# EAGLE schematic Claritone_Main (EAGLE 9.7.0)
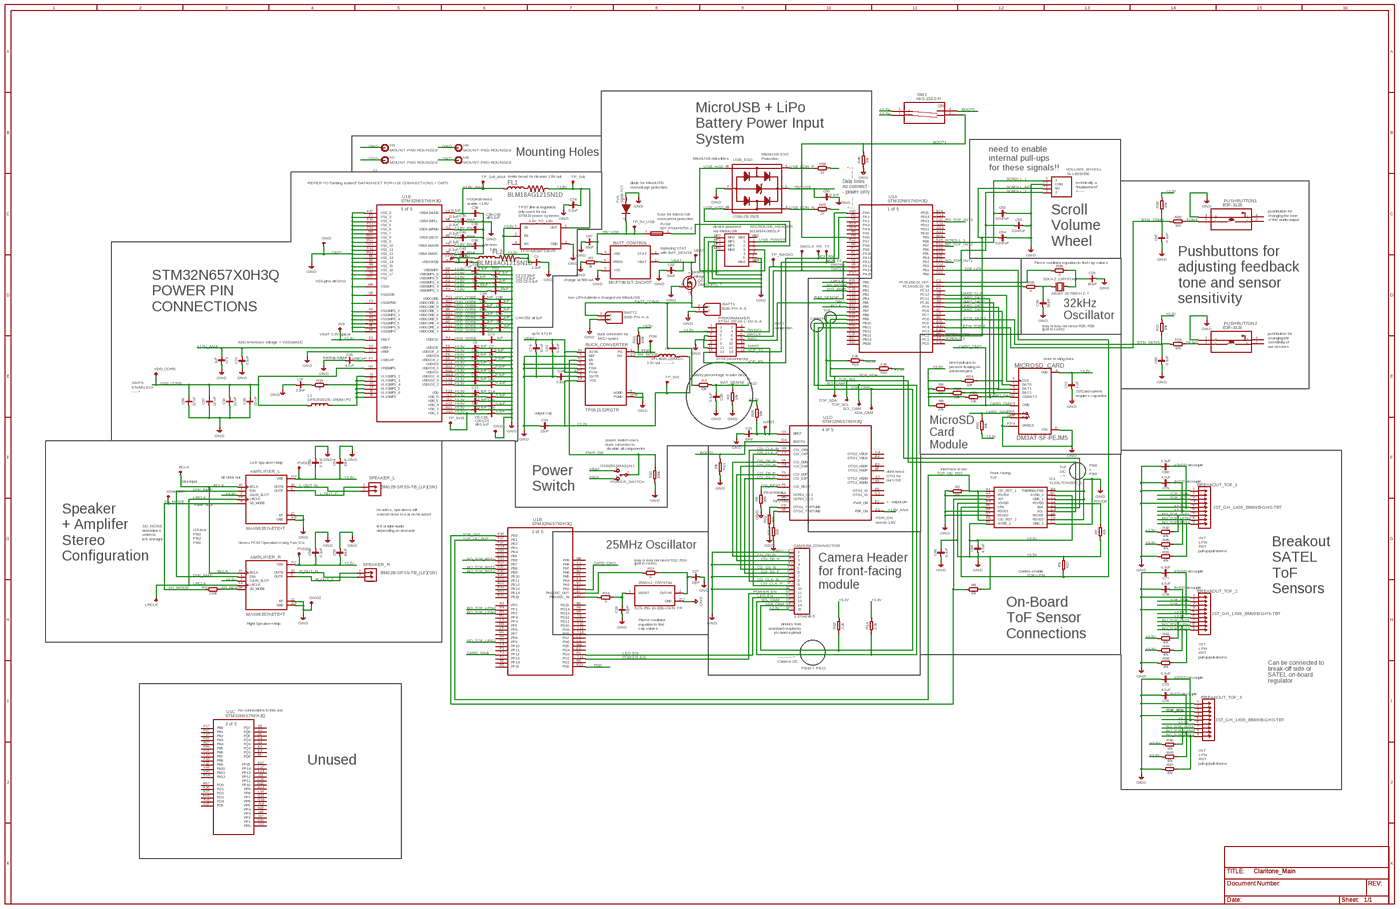
[diagram p0: schematic, sheet 1, overview]
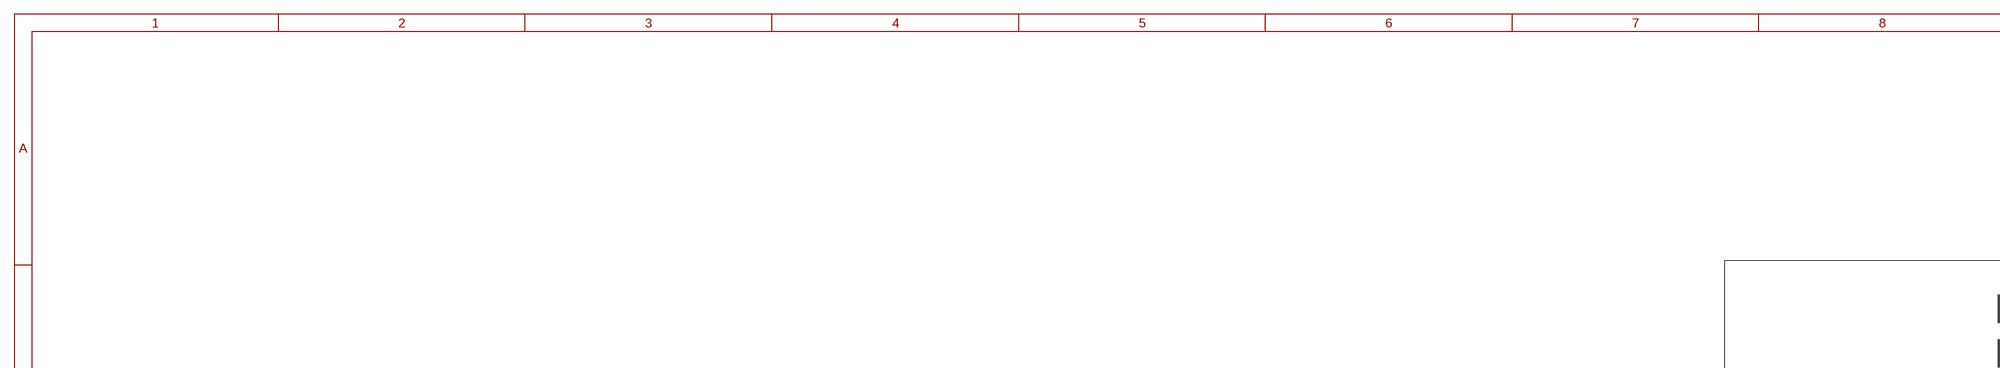
[diagram p1: schematic, sheet 1, part 1 of 4]
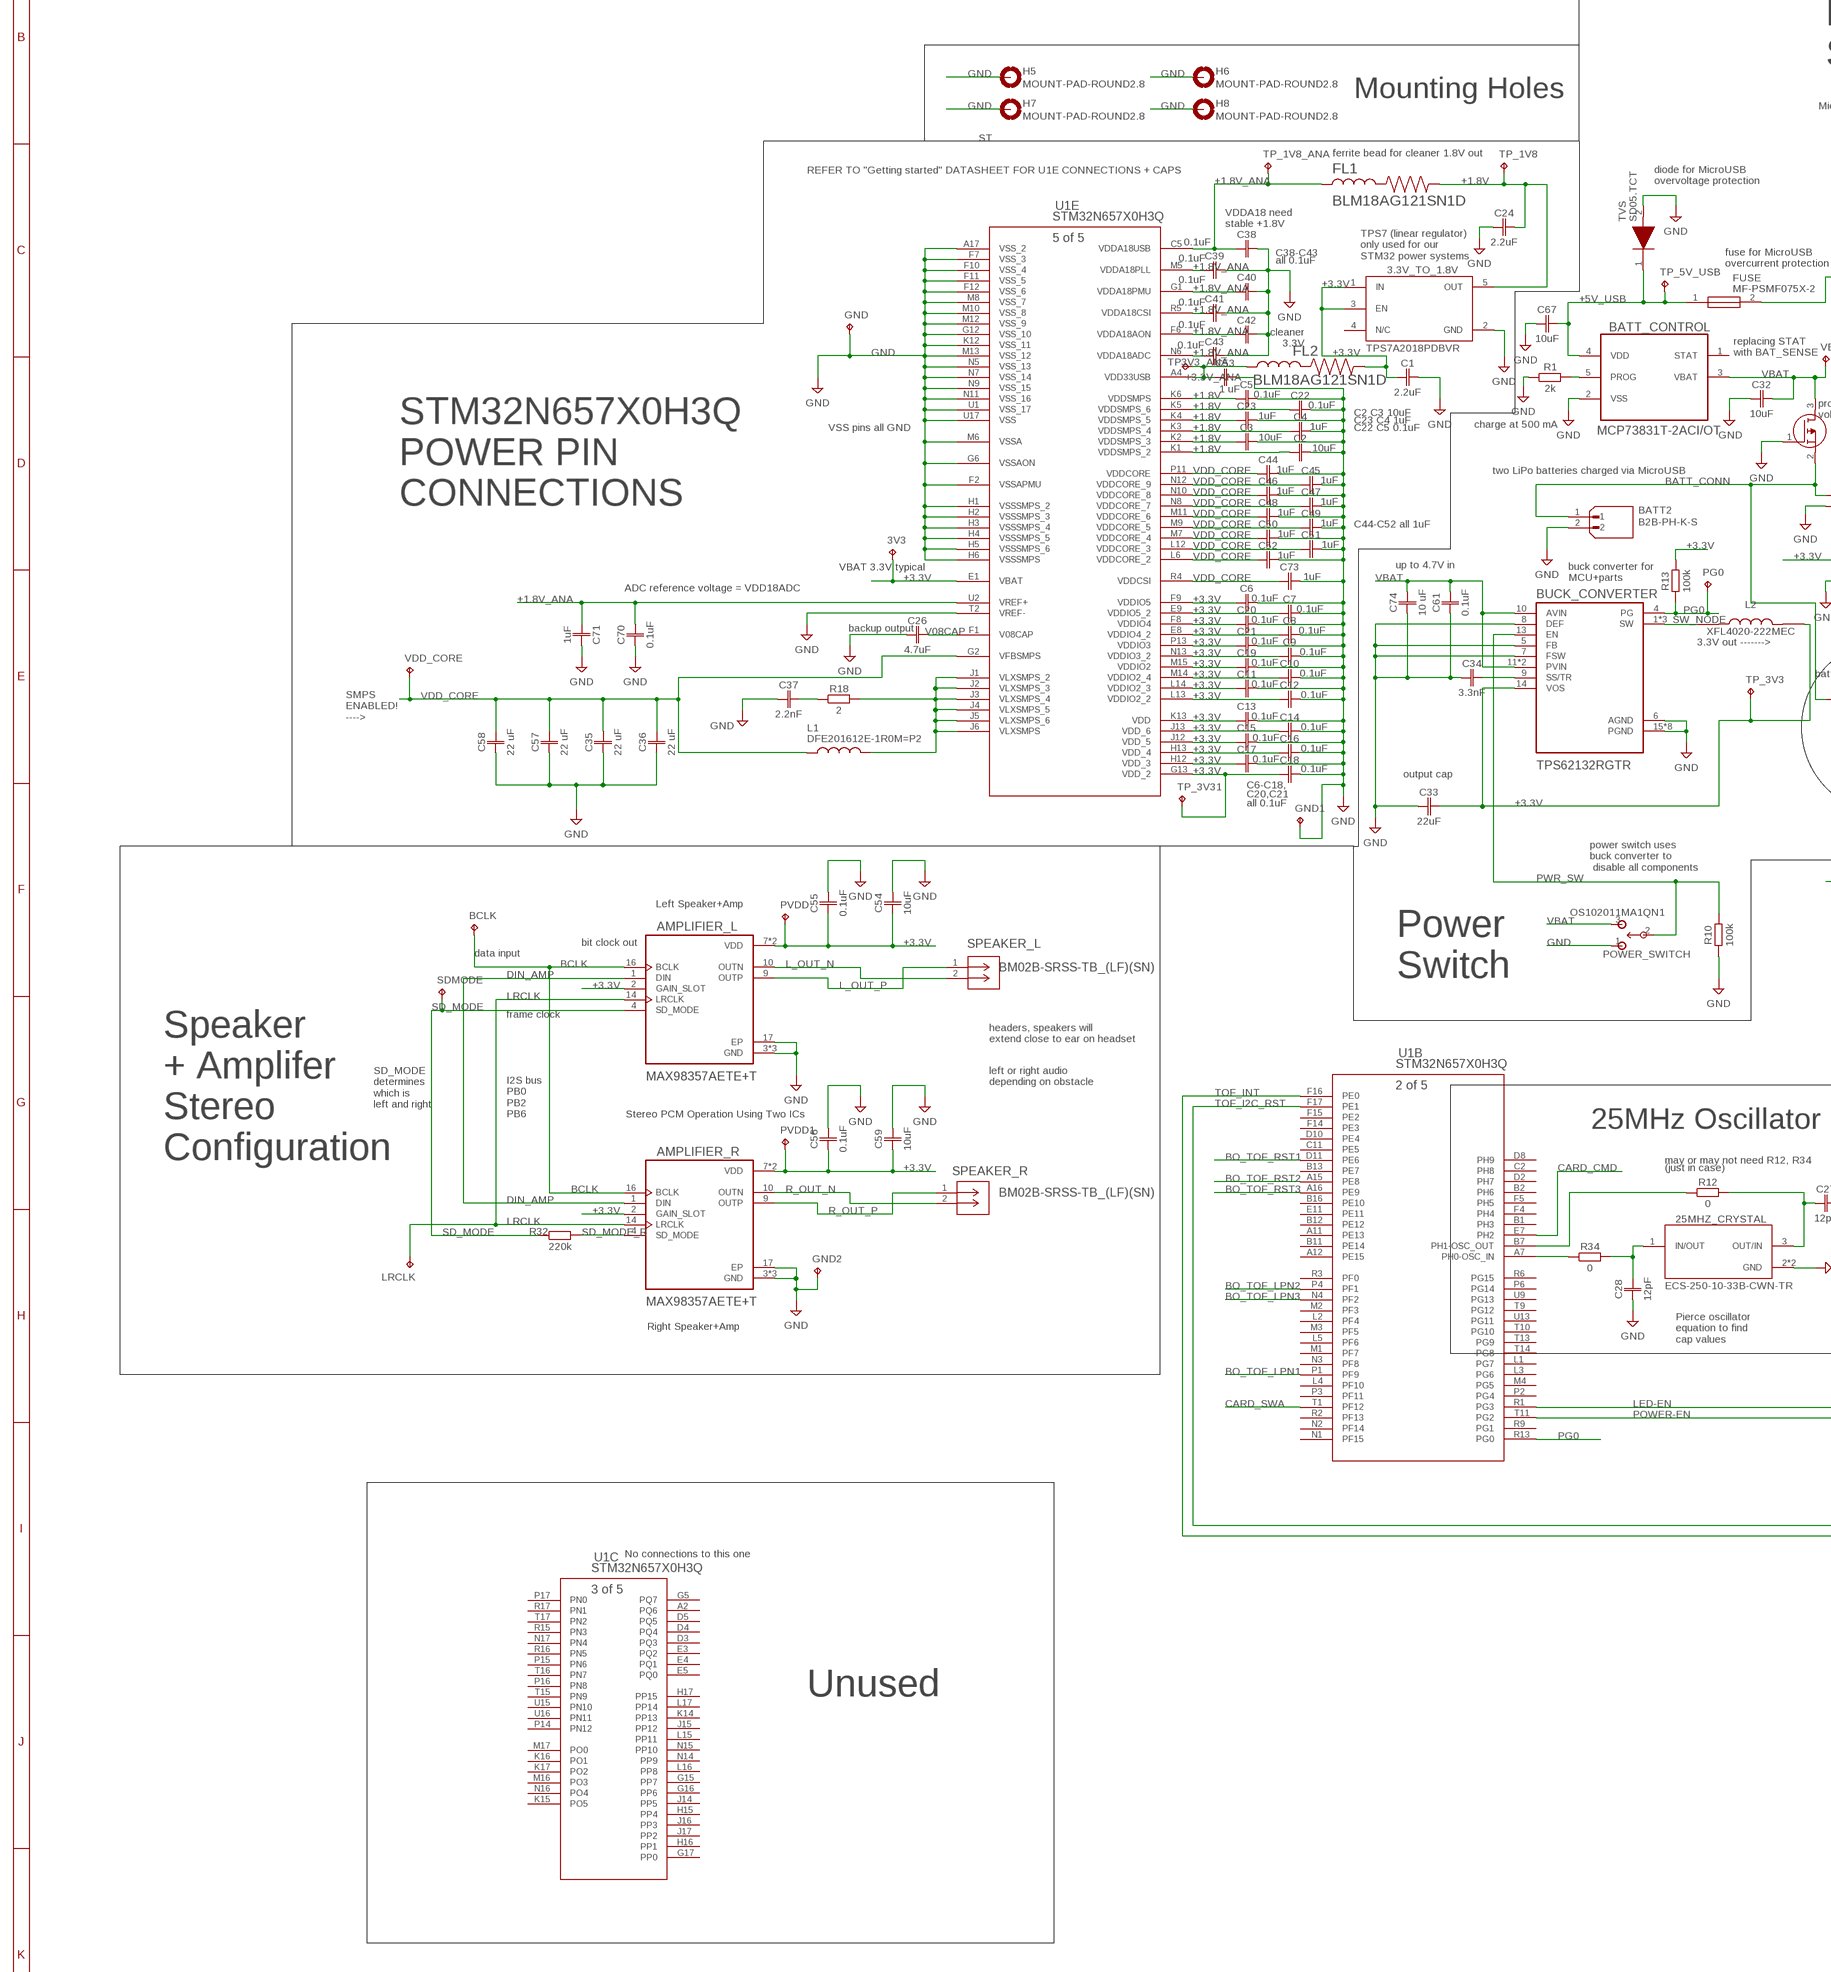
[diagram p2: schematic, sheet 1, part 2 of 4]
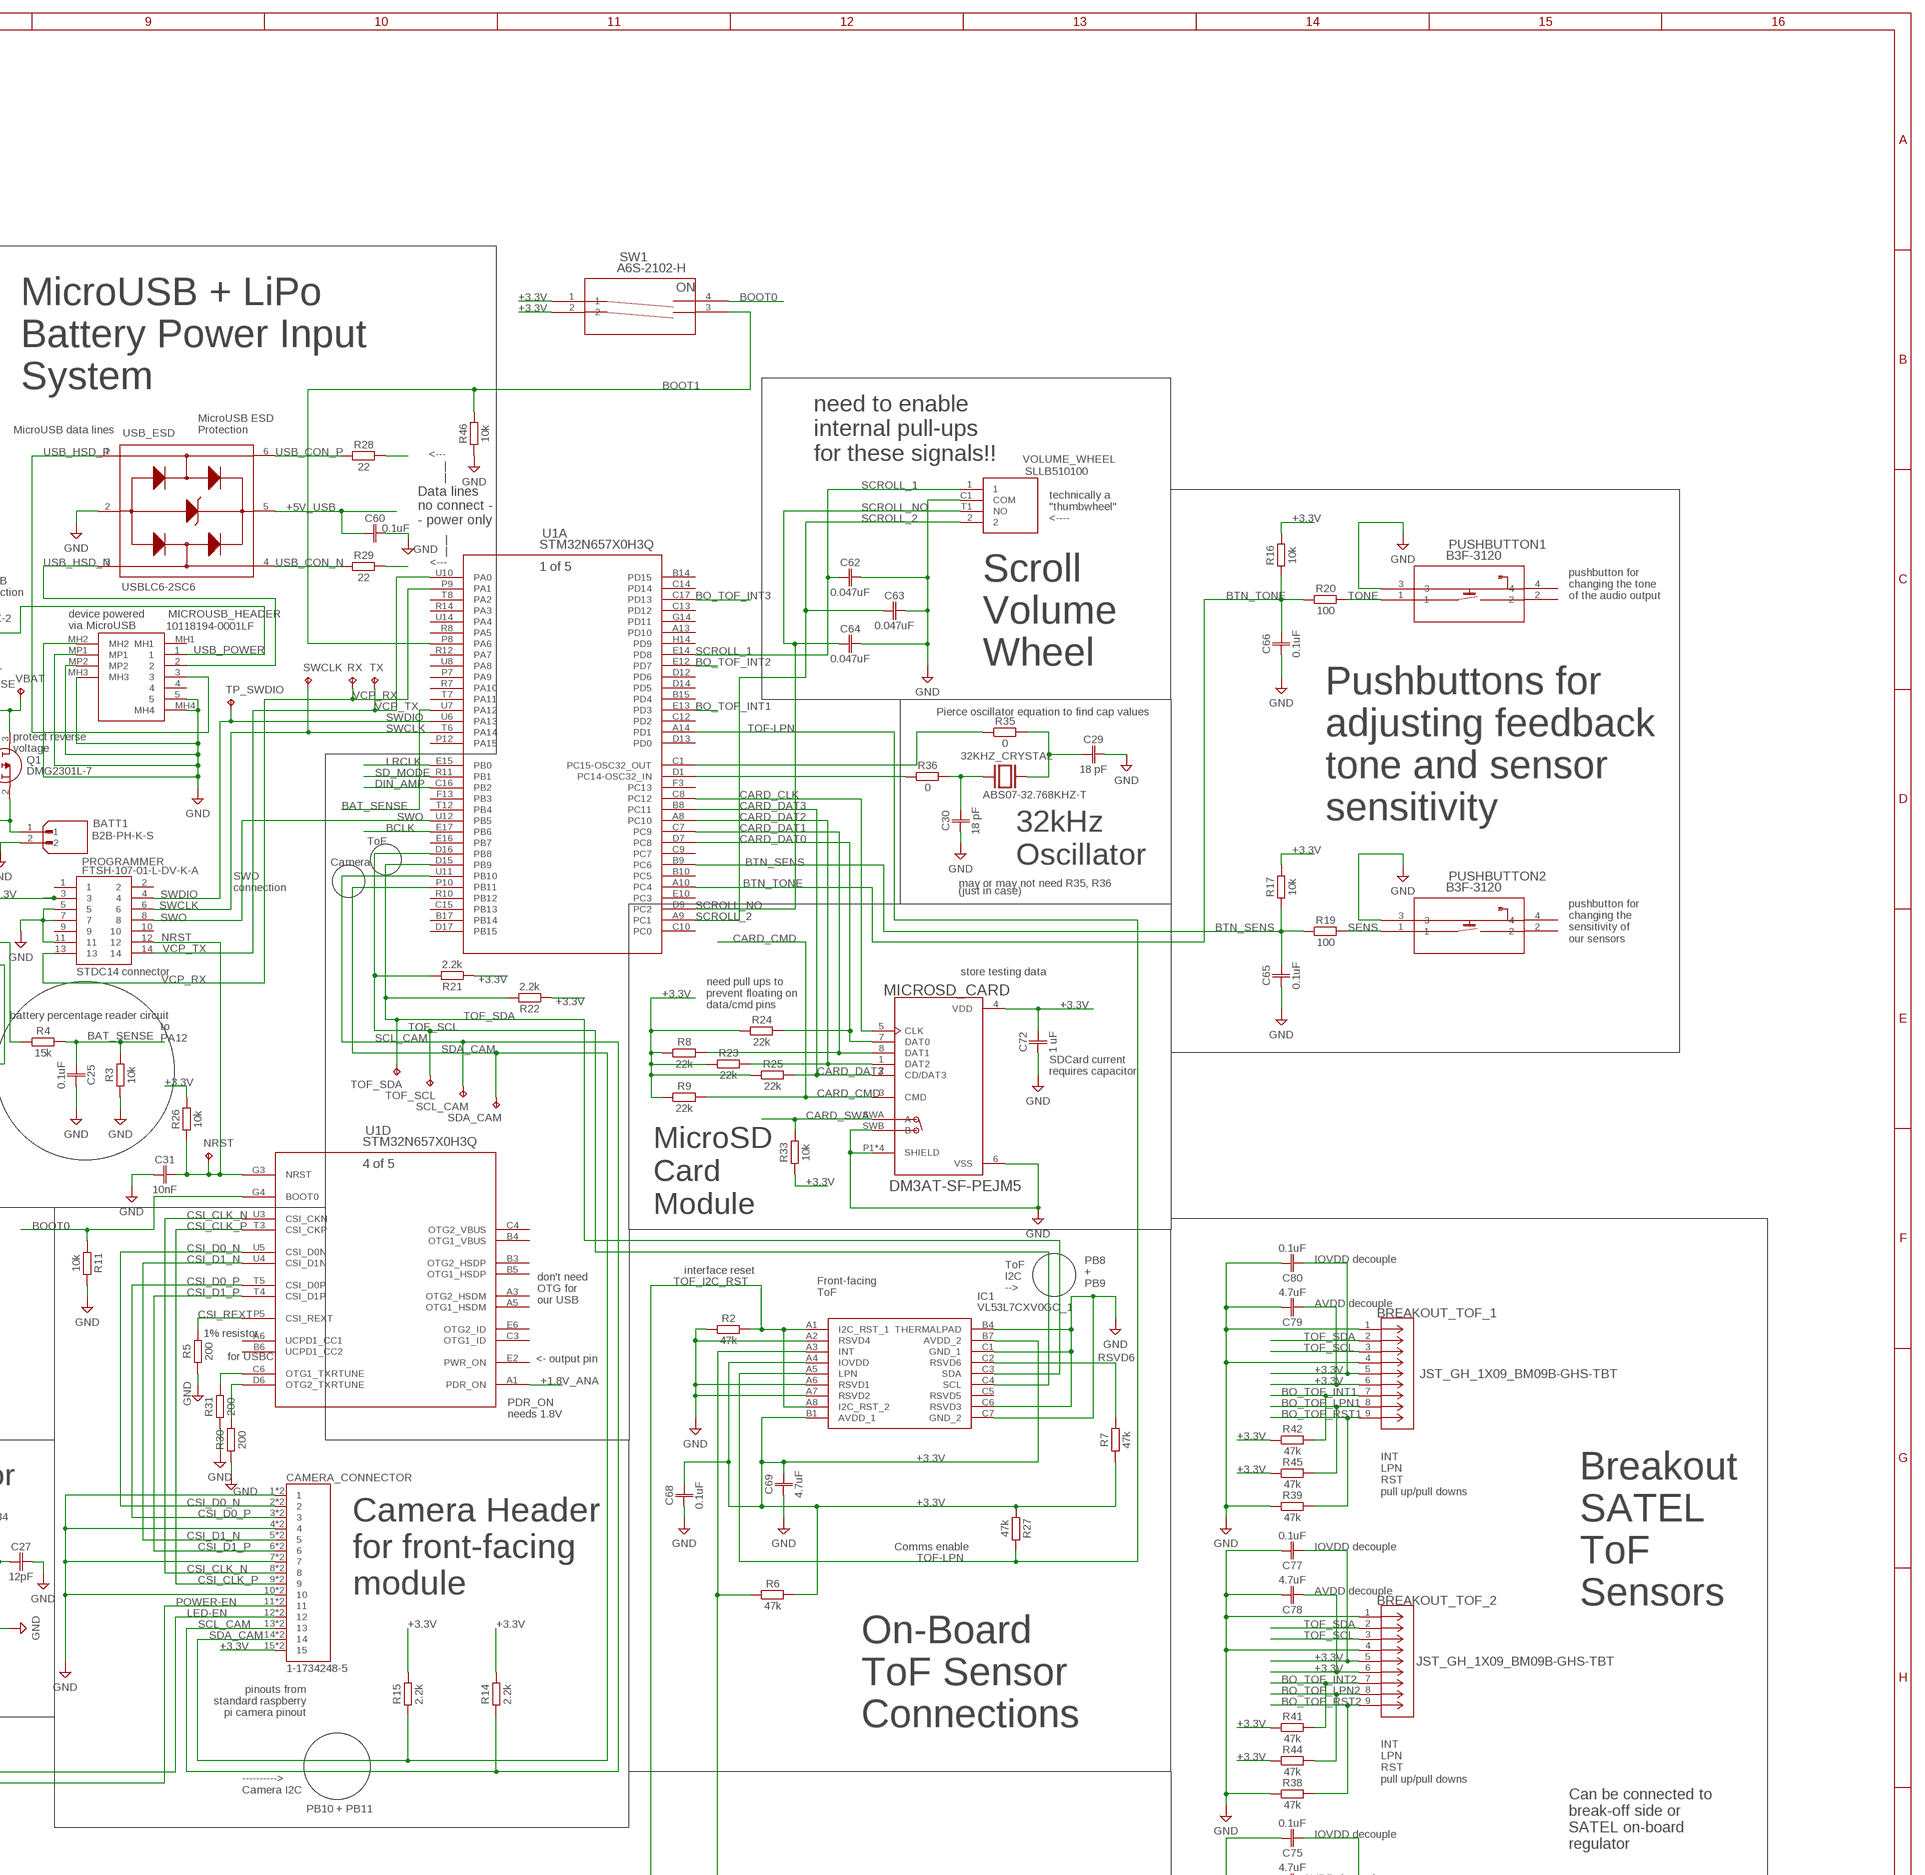
[diagram p3: schematic, sheet 1, part 3 of 4]
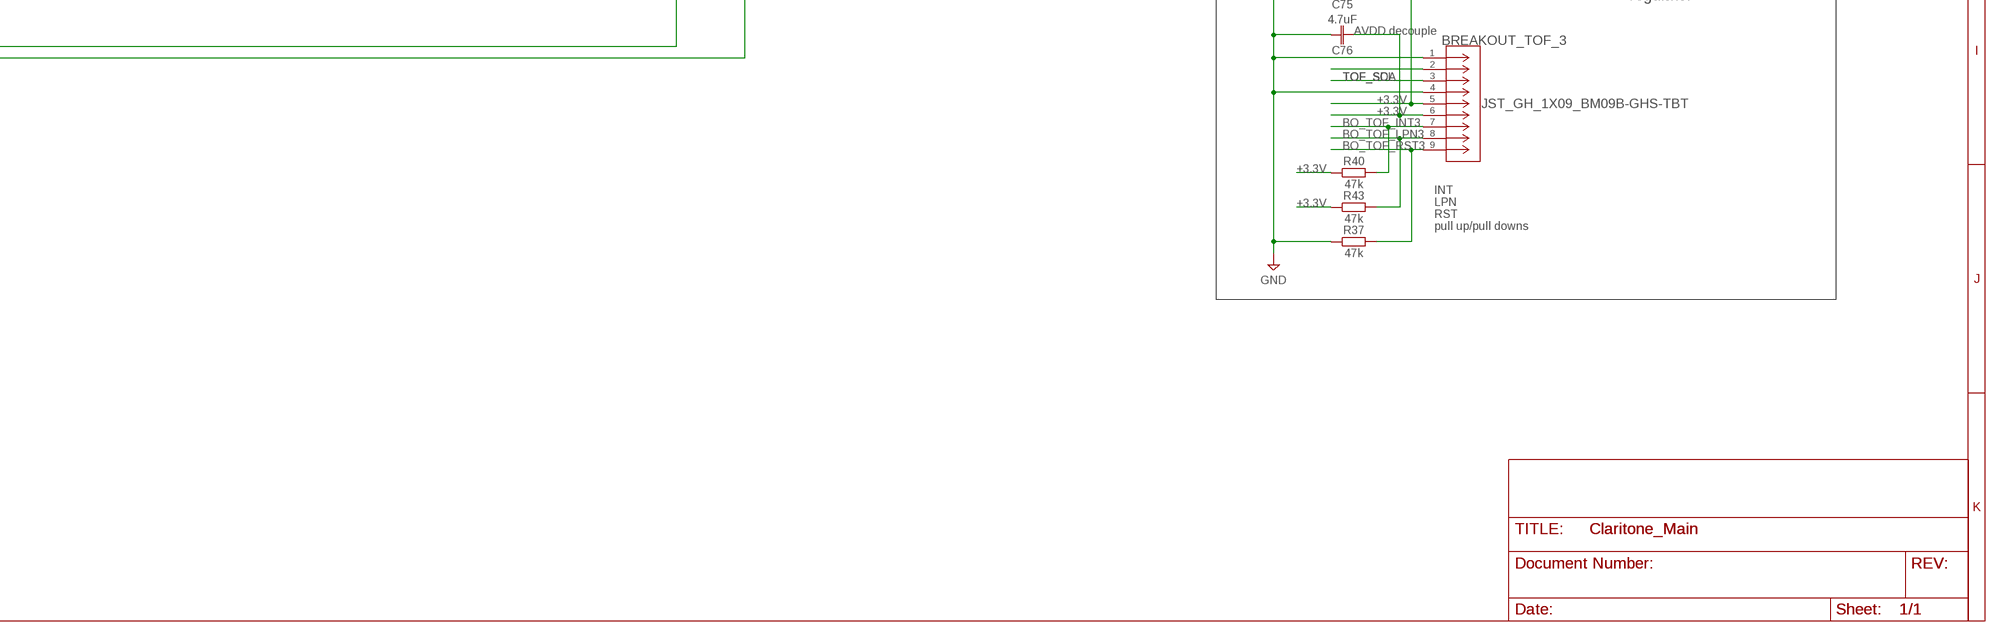
[diagram p4: schematic, sheet 1, part 4 of 4]

## Parts
3.3V_TO_1.8V  TPS7A2018PDBVR  [SOT95P280X145-5N(3)]
3V3  TPPAD1-13Y  [P1-13Y]
25MHZ_CRYSTAL  ECS-250-10-33B-CWN-TR  [XTAL_ECS-250-10-33B-CWN-TR]
32KHZ_CRYSTAL  ABS07-32.768KHZ-T  [XTAL_ABS07-32.768KHZ-T]
AMPLIFIER_L  MAX98357AETE+T  [QFN50P300X300X80-17N]
AMPLIFIER_R  MAX98357AETE+T  [QFN50P300X300X80-17N]
BATT1  B2B-PH-K-S  [JST_B2B-PH-K-S]
BATT2  B2B-PH-K-S  [JST_B2B-PH-K-S]
BATT_CONTROL  MCP73831T-2ACI/OT  [SOT95P280X145-5N(1)]
BCLK  TPTP06R  [TP06R]
BREAKOUT_TOF_1  JST_GH_1X09_BM09B-GHS-TBT  [CONN_BM09B-GHS-TBT_JST]
BREAKOUT_TOF_2  JST_GH_1X09_BM09B-GHS-TBT  [CONN_BM09B-GHS-TBT_JST]
BREAKOUT_TOF_3  JST_GH_1X09_BM09B-GHS-TBT  [CONN_BM09B-GHS-TBT_JST]
BUCK_CONVERTER  TPS62132RGTR  [QFN50P300X300X100-17N]
C1  2.2uF  C_CHIP-0402(1005-METRIC)  [CAPC1005X60]
C2  10uF  C_CHIP-0603(1608-METRIC)  [CAPC1608X85]
C3  10uF  C_CHIP-0603(1608-METRIC)  [CAPC1608X85]
C4  1uF  C_CHIP-0402(1005-METRIC)  [CAPC1005X60]
C5  0.1uF  C_CHIP-0402(1005-METRIC)  [CAPC1005X60]
C6  0.1uF  C_CHIP-0402(1005-METRIC)  [CAPC1005X60]
C7  0.1uF  C_CHIP-0402(1005-METRIC)  [CAPC1005X60]
C8  0.1uF  C_CHIP-0402(1005-METRIC)  [CAPC1005X60]
C9  0.1uF  C_CHIP-0402(1005-METRIC)  [CAPC1005X60]
C10  0.1uF  C_CHIP-0402(1005-METRIC)  [CAPC1005X60]
C11  0.1uF  C_CHIP-0402(1005-METRIC)  [CAPC1005X60]
C12  0.1uF  C_CHIP-0402(1005-METRIC)  [CAPC1005X60]
C13  0.1uF  C_CHIP-0402(1005-METRIC)  [CAPC1005X60]
C14  0.1uF  C_CHIP-0402(1005-METRIC)  [CAPC1005X60]
C15  0.1uF  C_CHIP-0402(1005-METRIC)  [CAPC1005X60]
C16  0.1uF  C_CHIP-0402(1005-METRIC)  [CAPC1005X60]
C17  0.1uF  C_CHIP-0402(1005-METRIC)  [CAPC1005X60]
C18  0.1uF  C_CHIP-0402(1005-METRIC)  [CAPC1005X60]
C19  0.1uF  C_CHIP-0402(1005-METRIC)  [CAPC1005X60]
C20  0.1uF  C_CHIP-0402(1005-METRIC)  [CAPC1005X60]
C21  0.1uF  C_CHIP-0402(1005-METRIC)  [CAPC1005X60]
C22  0.1uF  C_CHIP-0402(1005-METRIC)  [CAPC1005X60]
C23  1uF  C_CHIP-0402(1005-METRIC)  [CAPC1005X60]
C24  2.2uF  C_CHIP-0402(1005-METRIC)  [CAPC1005X60]
C25  0.1uF  C_CHIP-0402(1005-METRIC)  [CAPC1005X60]
C26  4.7uF  C_CHIP-0402(1005-METRIC)  [CAPC1005X60]
C27  12pF  C_CHIP-0402(1005-METRIC)  [CAPC1005X60]
C28  12pF  C_CHIP-0402(1005-METRIC)  [CAPC1005X60]
C29  18 pF  C_CHIP-0402(1005-METRIC)  [CAPC1005X60]
C30  18 pF  C_CHIP-0402(1005-METRIC)  [CAPC1005X60]
C31  10nF  C_CHIP-0402(1005-METRIC)  [CAPC1005X60]
C32  10uF  C_CHIP-0603(1608-METRIC)  [CAPC1608X85]
C33  22uF  C_CHIP-0603(1608-METRIC)  [CAPC1608X85]
C34  3.3nF  C_CHIP-0402(1005-METRIC)  [CAPC1005X60]
C35  22 uF  C_CHIP-0603(1608-METRIC)  [CAPC1608X85]
C36  22 uF  C_CHIP-0603(1608-METRIC)  [CAPC1608X85]
C37  2.2nF  C_CHIP-0402(1005-METRIC)  [CAPC1005X60]
C38  0.1uF  C_CHIP-0402(1005-METRIC)  [CAPC1005X60]
C39  0.1uF  C_CHIP-0402(1005-METRIC)  [CAPC1005X60]
C40  0.1uF  C_CHIP-0402(1005-METRIC)  [CAPC1005X60]
C41  0.1uF  C_CHIP-0402(1005-METRIC)  [CAPC1005X60]
C42  0.1uF  C_CHIP-0402(1005-METRIC)  [CAPC1005X60]
C43  0.1uF  C_CHIP-0402(1005-METRIC)  [CAPC1005X60]
C44  1uF  C_CHIP-0402(1005-METRIC)  [CAPC1005X60]
C45  1uF  C_CHIP-0402(1005-METRIC)  [CAPC1005X60]
C46  1uF  C_CHIP-0402(1005-METRIC)  [CAPC1005X60]
C47  1uF  C_CHIP-0402(1005-METRIC)  [CAPC1005X60]
C48  1uF  C_CHIP-0402(1005-METRIC)  [CAPC1005X60]
C49  1uF  C_CHIP-0402(1005-METRIC)  [CAPC1005X60]
C50  1uF  C_CHIP-0402(1005-METRIC)  [CAPC1005X60]
C51  1uF  C_CHIP-0402(1005-METRIC)  [CAPC1005X60]
C52  1uF  C_CHIP-0402(1005-METRIC)  [CAPC1005X60]
C53  1 uF  C_CHIP-0402(1005-METRIC)  [CAPC1005X60]
C54  10uF  C_CHIP-0603(1608-METRIC)  [CAPC1608X85]
C55  0.1uF  C_CHIP-0402(1005-METRIC)  [CAPC1005X60]
C56  0.1uF  C_CHIP-0402(1005-METRIC)  [CAPC1005X60]
C57  22 uF  C_CHIP-0603(1608-METRIC)  [CAPC1608X85]
C58  22 uF  C_CHIP-0603(1608-METRIC)  [CAPC1608X85]
C59  10uF  C_CHIP-0603(1608-METRIC)  [CAPC1608X85]
C60  0.1uF  C_CHIP-0402(1005-METRIC)  [CAPC1005X60]
C61  0.1uF  C_CHIP-0402(1005-METRIC)  [CAPC1005X60]
C62  0.047uF  C_CHIP-0402(1005-METRIC)  [CAPC1005X60]
C63  0.047uF  C_CHIP-0402(1005-METRIC)  [CAPC1005X60]
C64  0.047uF  C_CHIP-0402(1005-METRIC)  [CAPC1005X60]
C65  0.1uF  C_CHIP-0402(1005-METRIC)  [CAPC1005X60]
C66  0.1uF  C_CHIP-0402(1005-METRIC)  [CAPC1005X60]
C67  10uF  C_CHIP-0603(1608-METRIC)  [CAPC1608X85]
C68  0.1uF  C_CHIP-0402(1005-METRIC)  [CAPC1005X60]
C69  4.7uF  C_CHIP-0603(1608-METRIC)  [CAPC1608X85]
C70  0.1uF  C_CHIP-0402(1005-METRIC)  [CAPC1005X60]
C71  1uF  C_CHIP-0402(1005-METRIC)  [CAPC1005X60]
C72  1 uF  C_CHIP-0402(1005-METRIC)  [CAPC1005X60]
C73  1uF  C_CHIP-0402(1005-METRIC)  [CAPC1005X60]
C74  10 uF  C_CHIP-0603(1608-METRIC)  [CAPC1608X85]
C75  0.1uF  C_CHIP-0402(1005-METRIC)  [CAPC1005X60]
C76  4.7uF  C_CHIP-0603(1608-METRIC)  [CAPC1608X85]
C77  0.1uF  C_CHIP-0402(1005-METRIC)  [CAPC1005X60]
C78  4.7uF  C_CHIP-0603(1608-METRIC)  [CAPC1608X85]
C79  4.7uF  C_CHIP-0603(1608-METRIC)  [CAPC1608X85]
C80  0.1uF  C_CHIP-0402(1005-METRIC)  [CAPC1005X60]
CAMERA_CONNECTOR  1-1734248-5  [TE_1-1734248-5]
FL1  BLM18AG121SN1D  [BEADC1608X95N]
FL2  BLM18AG121SN1D  [BEADC1608X95N]
FUSE  MF-PSMF075X-2  [MFPSMF075X2]
GND  TPPAD1-13Y  [P1-13Y]
GND1  TPTP08R  [TP08R]
GND2  TPTP08R  [TP08R]
H5  MOUNT-PAD-ROUND2.8  [2,8-PAD]
H6  MOUNT-PAD-ROUND2.8  [2,8-PAD]
H7  MOUNT-PAD-ROUND2.8  [2,8-PAD]
H8  MOUNT-PAD-ROUND2.8  [2,8-PAD]
IC1  VL53L7CXV0GC_1  [VL53L7CXV0GC1]
L1  DFE201612E-1R0M=P2  [INDC2016X120N]
L2  XFL4020-222MEC  [IND_XFL4020-222MEC]
LRCLK  TPTP06R  [TP06R]
MICROSD_CARD  DM3AT-SF-PEJM5  [HRS_DM3AT-SF-PEJM5]
MICROUSB_HEADER  10118194-0001LF  [101181940001LF]
NRST  TPTP06R  [TP06R]
PG0  TPTP06R  [TP06R]
POWER_SWITCH  OS102011MA1QN1  [SWITCH_11MA1QN1]
PROGRAMMER  FTSH-107-01-L-DV-K-A  [FTSH-107-XX-YYY-DV-K-A]
PUSHBUTTON1  B3F-3120  [SW_B3F-3120_OMR]
PUSHBUTTON2  B3F-3120  [SW_B3F-3120_OMR]
PVDD  TPTP06R  [TP06R]
PVDD1  TPTP06R  [TP06R]
Q1  DMG2301L-7  [SOT96P240X115-3N]
R1  2k  RESISTOR__CHIP-0402(1005-METRIC)  [RESC1005X40]
R2  47k  RESISTOR__CHIP-0402(1005-METRIC)  [RESC1005X40]
R3  10k  RESISTOR__CHIP-0402(1005-METRIC)  [RESC1005X40]
R4  15k  RESISTOR__CHIP-0402(1005-METRIC)  [RESC1005X40]
R5  200  RESISTOR__CHIP-0402(1005-METRIC)  [RESC1005X40]
R6  47k  RESISTOR__CHIP-0402(1005-METRIC)  [RESC1005X40]
R7  47k  RESISTOR__CHIP-0402(1005-METRIC)  [RESC1005X40]
R8  22k  RESISTOR__CHIP-0402(1005-METRIC)  [RESC1005X40]
R9  22k  RESISTOR__CHIP-0402(1005-METRIC)  [RESC1005X40]
R10  100k  RESISTOR__CHIP-0402(1005-METRIC)  [RESC1005X40]
R11  10k  RESISTOR__CHIP-0402(1005-METRIC)  [RESC1005X40]
R12  0  RESISTOR__CHIP-0402(1005-METRIC)  [RESC1005X40]
R13  100k  RESISTOR__CHIP-0402(1005-METRIC)  [RESC1005X40]
R14  2.2k  RESISTOR__CHIP-0402(1005-METRIC)  [RESC1005X40]
R15  2.2k  RESISTOR__CHIP-0402(1005-METRIC)  [RESC1005X40]
R16  10k  RESISTOR__CHIP-0402(1005-METRIC)  [RESC1005X40]
R17  10k  RESISTOR__CHIP-0402(1005-METRIC)  [RESC1005X40]
R18  2  RESISTOR__CHIP-0402(1005-METRIC)  [RESC1005X40]
R19  100  RESISTOR__CHIP-0402(1005-METRIC)  [RESC1005X40]
R20  100  RESISTOR__CHIP-0402(1005-METRIC)  [RESC1005X40]
R21  2.2k  RESISTOR__CHIP-0402(1005-METRIC)  [RESC1005X40]
R22  2.2k  RESISTOR__CHIP-0402(1005-METRIC)  [RESC1005X40]
R23  22k  RESISTOR__CHIP-0402(1005-METRIC)  [RESC1005X40]
R24  22k  RESISTOR__CHIP-0402(1005-METRIC)  [RESC1005X40]
R25  22k  RESISTOR__CHIP-0402(1005-METRIC)  [RESC1005X40]
R26  10k  RESISTOR__CHIP-0402(1005-METRIC)  [RESC1005X40]
R27  47k  RESISTOR__CHIP-0402(1005-METRIC)  [RESC1005X40]
R28  22  RESISTOR__CHIP-0402(1005-METRIC)  [RESC1005X40]
R29  22  RESISTOR__CHIP-0402(1005-METRIC)  [RESC1005X40]
R30  200  RESISTOR__CHIP-0402(1005-METRIC)  [RESC1005X40]
R31  200  RESISTOR__CHIP-0402(1005-METRIC)  [RESC1005X40]
R32  220k  RESISTOR__CHIP-0402(1005-METRIC)  [RESC1005X40]
R33  10k  RESISTOR__CHIP-0402(1005-METRIC)  [RESC1005X40]
R34  0  RESISTOR__CHIP-0402(1005-METRIC)  [RESC1005X40]
R35  0  RESISTOR__CHIP-0402(1005-METRIC)  [RESC1005X40]
R36  0  RESISTOR__CHIP-0402(1005-METRIC)  [RESC1005X40]
R37  47k  RESISTOR__CHIP-0402(1005-METRIC)  [RESC1005X40]
R38  47k  RESISTOR__CHIP-0402(1005-METRIC)  [RESC1005X40]
R39  47k  RESISTOR__CHIP-0402(1005-METRIC)  [RESC1005X40]
R40  47k  RESISTOR__CHIP-0402(1005-METRIC)  [RESC1005X40]
R41  47k  RESISTOR__CHIP-0402(1005-METRIC)  [RESC1005X40]
R42  47k  RESISTOR__CHIP-0402(1005-METRIC)  [RESC1005X40]
R43  47k  RESISTOR__CHIP-0402(1005-METRIC)  [RESC1005X40]
R44  47k  RESISTOR__CHIP-0402(1005-METRIC)  [RESC1005X40]
R45  47k  RESISTOR__CHIP-0402(1005-METRIC)  [RESC1005X40]
R46  10k  RESISTOR__CHIP-0402(1005-METRIC)  [RESC1005X40]
RX  TPTP06R  [TP06R]
SCL_CAM  TPTP06R  [TP06R]
SDA_CAM  TPTP06R  [TP06R]
SDMODE  TPTP06R  [TP06R]
SPEAKER_L  BM02B-SRSS-TB_(LF)(SN)  [CONN_BM02B-SRSS-TB_JST]
SPEAKER_R  BM02B-SRSS-TB_(LF)(SN)  [CONN_BM02B-SRSS-TB_JST]
SW1  A6S-2102-H  [SW_A6S-2102-H_OMR]
SWCLK  TPTP06R  [TP06R]
TOF_SCL  TPTP06R  [TP06R]
TOF_SDA  TPTP06R  [TP06R]
TP3V3_ANA  TPTP06R  [TP06R]
TP_1V8  TPTP06R  [TP06R]
TP_1V8_ANA  TPTP06R  [TP06R]
TP_3V3  TPTP06R  [TP06R]
TP_3V31  TPTP06R  [TP06R]
TP_5V_USB  TPTP06R  [TP06R]
TP_SWDIO  TPTP06R  [TP06R]
TVS  SD05.TCT  [SOD2513X110N]
TX  TPTP06R  [TP06R]
U1  STM32N657X0H3Q  [VFBGA264_14X14_STM]
USB_ESD  USBLC6-2SC6  [SOT95P280X145-6N]
VBAT  TPTP06R  [TP06R]
VDD_CORE  TPTP06R  [TP06R]
VOLUME_WHEEL  SLLB510100  [SLLB510100]

## Nets
+1.8V: 3.3V_TO_1.8V.5(OUT) C2.1 C3.1 C4.1 C5.1 C22.1 C23.1 C24.2 FL1.2 TP_1V8.TP U1.K1(E:VDDSMPS_2) U1.K2(E:VDDSMPS_3) U1.K3(E:VDDSMPS_4) U1.K4(E:VDDSMPS_5) U1.K5(E:VDDSMPS_6) U1.K6(E:VDDSMPS)
+1.8V_ANA: C38.1 C39.1 C40.1 C41.1 C42.1 C43.1 C70.2 C71.1 FL1.1 TP_1V8_ANA.TP U1.A1(D:PDR_ON) U1.C5(E:VDDA18USB) U1.F6(E:VDDA18AON) U1.G1(E:VDDA18PMU) U1.M5(E:VDDA18PLL) U1.N6(E:VDDA18ADC) U1.R5(E:VDDA18CSI) U1.U2(E:VREF+)
+3.3V: 3.3V_TO_1.8V.1(IN) 3.3V_TO_1.8V.3(EN) 3V3.TP AMPLIFIER_L.2(GAIN_SLOT) AMPLIFIER_L.7(VDD) AMPLIFIER_L.8(VDD) AMPLIFIER_R.2(GAIN_SLOT) AMPLIFIER_R.7(VDD) AMPLIFIER_R.8(VDD) BREAKOUT_TOF_1.5 BREAKOUT_TOF_1.6 BREAKOUT_TOF_2.5 BREAKOUT_TOF_2.6 BREAKOUT_TOF_3.5 BREAKOUT_TOF_3.6 BUCK_CONVERTER.14(VOS) C1.1 C6.1 C7.1 C8.1 C9.1 C10.1 C11.1 C12.1 C13.1 C14.1 C15.1 C16.1 C17.1 C18.1 C19.1 C20.1 C21.1 C33.2 C54.1 C55.1 C56.1 C59.1 C68.2 C69.2 C72.2 C75.1 C76.1 C77.1 C78.1 C79.1 C80.1 CAMERA_CONNECTOR.15 CAMERA_CONNECTOR.15_1 FL2.2 IC1.A4(IOVDD) IC1.B1(AVDD_1) IC1.B7(AVDD_2) L2.2 MICROSD_CARD.4(VDD) PROGRAMMER.3 PVDD1.TP PVDD.TP R6.2 R7.1 R8.1 R9.1 R13.2 R14.2 R15.2 R16.2 R17.2 R21.1 R22.1 R23.1 R24.1 R25.1 R26.2 R27.1 R33.1 R40.1 R41.1 R42.1 R43.1 R44.1 R45.1 SW1.1 SW1.2 TP_3V3.TP TP_3V31.TP U1.E1(E:VBAT) U1.E8(E:VDDIO4_2) U1.E9(E:VDDIO5_2) U1.F8(E:VDDIO4) U1.F9(E:VDDIO5) U1.G13(E:VDD_2) U1.H12(E:VDD_3) U1.H13(E:VDD_4) U1.J12(E:VDD_5) U1.J13(E:VDD_6) U1.K13(E:VDD) U1.L13(E:VDDIO2_2) U1.L14(E:VDDIO2_3) U1.M14(E:VDDIO2_4) U1.M15(E:VDDIO2) U1.N13(E:VDDIO3_2) U1.P13(E:VDDIO3)
+3.3V_ANA: C53.1 FL2.1 TP3V3_ANA.TP U1.A4(E:VDD33USB)
+5V_USB: BATT_CONTROL.4(VDD) C60.1 C67.2 FUSE.1 TP_5V_USB.TP TVS.1(K) USB_ESD.5(VBUS)
BAT_SENSE: C25.1 R3.2 R4.2 U1.U7(A:PA12)
BATT_CONN: BATT1.1 BATT2.1 Q1.2(S) R4.1
BCLK: AMPLIFIER_L.16(BCLK) AMPLIFIER_R.16(BCLK) BCLK.TP U1.E17(A:PB6)
BO_TOF_INT1: BREAKOUT_TOF_1.7 R42.2 U1.E13(A:PD3)
BO_TOF_INT2: BREAKOUT_TOF_2.7 R41.2 U1.E12(A:PD7)
BO_TOF_INT3: BREAKOUT_TOF_3.7 R40.2 U1.C17(A:PD13)
BO_TOF_LPN1: BREAKOUT_TOF_1.8 R45.2 U1.P1(B:PF9)
BO_TOF_LPN2: BREAKOUT_TOF_2.8 R44.2 U1.P4(B:PF1)
BO_TOF_LPN3: BREAKOUT_TOF_3.8 R43.2 U1.N4(B:PF2)
BO_TOF_RST1: BREAKOUT_TOF_1.9 R39.2 U1.D11(B:PE6)
BO_TOF_RST2: BREAKOUT_TOF_2.9 R38.2 U1.A15(B:PE8)
BO_TOF_RST3: BREAKOUT_TOF_3.9 R37.2 U1.A16(B:PE9)
BOOT0: R11.1 SW1.4 U1.G4(D:BOOT0)
BOOT1: R46.2 SW1.3 U1.P8(A:PA6)
BTN_SENS: C65.2 R17.1 R19.1 U1.B9(A:PC6)
BTN_TONE: C66.2 R16.1 R20.1 U1.A10(A:PC4)
CARD_CLK: MICROSD_CARD.5(CLK) U1.C8(A:PC12)
CARD_CMD: MICROSD_CARD.3(CMD) R9.2 U1.E7(B:PH2)
CARD_DAT0: MICROSD_CARD.7(DAT0) R24.2 U1.D7(A:PC8)
CARD_DAT1: MICROSD_CARD.8(DAT1) R8.2 U1.C7(A:PC9)
CARD_DAT2: MICROSD_CARD.1(DAT2) R23.2 U1.A8(A:PC10)
CARD_DAT3: MICROSD_CARD.2(CD/DAT3) R25.2 U1.B8(A:PC11)
CARD_SWA: MICROSD_CARD.SWA(A) R33.2 U1.T1(B:PF12)
CSI_CLK_N: CAMERA_CONNECTOR.8 CAMERA_CONNECTOR.8_1 U1.U3(D:CSI_CKN)
CSI_CLK_P: CAMERA_CONNECTOR.9 CAMERA_CONNECTOR.9_1 U1.T3(D:CSI_CKP)
CSI_D0_N: CAMERA_CONNECTOR.2 CAMERA_CONNECTOR.2_1 U1.U5(D:CSI_D0N)
CSI_D0_P: CAMERA_CONNECTOR.3 CAMERA_CONNECTOR.3_1 U1.T5(D:CSI_D0P)
CSI_D1_N: CAMERA_CONNECTOR.5 CAMERA_CONNECTOR.5_1 U1.U4(D:CSI_D1N)
CSI_D1_P: CAMERA_CONNECTOR.6 CAMERA_CONNECTOR.6_1 U1.T4(D:CSI_D1P)
CSI_REXT: R5.2 U1.P5(D:CSI_REXT)
DIN_AMP: AMPLIFIER_L.1(DIN) AMPLIFIER_R.1(DIN) U1.C16(A:PB2)
GND: 3.3V_TO_1.8V.2(GND) 25MHZ_CRYSTAL.2(GND) 25MHZ_CRYSTAL.4(GND) AMPLIFIER_L.3(GND) AMPLIFIER_L.11(GND) AMPLIFIER_L.15(GND) AMPLIFIER_L.17(EP) AMPLIFIER_R.3(GND) AMPLIFIER_R.11(GND) AMPLIFIER_R.15(GND) AMPLIFIER_R.17(EP) BATT1.2 BATT2.2 BATT_CONTROL.2(VSS) BREAKOUT_TOF_1.1 BREAKOUT_TOF_1.4 BREAKOUT_TOF_2.1 BREAKOUT_TOF_2.4 BREAKOUT_TOF_3.1 BREAKOUT_TOF_3.4 BUCK_CONVERTER.5(FB) BUCK_CONVERTER.6(AGND) BUCK_CONVERTER.7(FSW) BUCK_CONVERTER.8(DEF) BUCK_CONVERTER.15(PGND) BUCK_CONVERTER.16(PGND) BUCK_CONVERTER.17(PGND) BUCK_CONVERTER.18(PGND) BUCK_CONVERTER.19(PGND) BUCK_CONVERTER.20(PGND) BUCK_CONVERTER.21(PGND) BUCK_CONVERTER.22(PGND) C1.2 C2.2 C3.2 C4.2 C5.2 C6.2 C7.2 C8.2 C9.2 C10.2 C11.2 C12.2 C13.2 C14.2 C15.2 C16.2 C17.2 C18.2 C19.2 C20.2 C21.2 C22.2 C23.2 C24.1 C25.2 C26.1 C27.2 C28.1 C29.2 C30.1 C31.1 C32.1 C33.1 C34.1 C35.1 C36.1 C37.1 C38.2 C39.2 C40.2 C41.2 C42.2 C43.2 C44.2 C45.2 C46.2 C47.2 C48.2 C49.2 C50.2 C51.2 C52.2 C53.2 C54.2 C55.2 C56.2 C57.1 C58.1 C59.2 C60.2 C61.1 C62.2 C63.2 C64.2 C65.1 C66.1 C67.1 C68.1 C69.1 C70.1 C71.2 C72.1 C73.2 C74.1 C75.2 C76.2 C77.2 C78.2 C79.2 C80.2 CAMERA_CONNECTOR.1 CAMERA_CONNECTOR.1_1 CAMERA_CONNECTOR.4 CAMERA_CONNECTOR.4_1 CAMERA_CONNECTOR.7 CAMERA_CONNECTOR.7_1 CAMERA_CONNECTOR.10 CAMERA_CONNECTOR.10_1 GND1.TP GND2.TP GND.TP H5.B2,8(MOUNT) H6.B2,8(MOUNT) H7.B2,8(MOUNT) H8.B2,8(MOUNT) IC1.A2(RSVD4) IC1.A6(RSVD1) IC1.A7(RSVD2) IC1.B4(THERMALPAD) IC1.C1(GND_1) IC1.C6(RSVD3) IC1.C7(GND_2) MICROSD_CARD.6(VSS) MICROSD_CARD.P1(SHIELD) MICROSD_CARD.P2(SHIELD) MICROSD_CARD.P3(SHIELD) MICROSD_CARD.P4(SHIELD) MICROSD_CARD.SWB(B) MICROUSB_HEADER.5 MICROUSB_HEADER.MH2 MICROUSB_HEADER.MH3 MICROUSB_HEADER.MH4 MICROUSB_HEADER.MP1 MICROUSB_HEADER.MP2 POWER_SWITCH.1 PROGRAMMER.5 PROGRAMMER.7 PROGRAMMER.11 PUSHBUTTON1.3 PUSHBUTTON2.3 Q1.1(G) R1.1 R2.1 R3.1 R5.1 R10.1 R11.2 R30.1 R31.1 R37.1 R38.1 R39.1 R46.1 TVS.2(A) U1.A17(E:VSS_2) U1.F2(E:VSSAPMU) U1.F7(E:VSS_3) U1.F10(E:VSS_4) U1.F11(E:VSS_5) U1.F12(E:VSS_6) U1.G6(E:VSSAON) U1.G12(E:VSS_10) U1.H1(E:VSSSMPS_2) U1.H2(E:VSSSMPS_3) U1.H3(E:VSSSMPS_4) U1.H4(E:VSSSMPS_5) U1.H5(E:VSSSMPS_6) U1.H6(E:VSSSMPS) U1.K12(E:VSS_11) U1.M6(E:VSSA) U1.M8(E:VSS_7) U1.M10(E:VSS_8) U1.M12(E:VSS_9) U1.M13(E:VSS_12) U1.N5(E:VSS_13) U1.N7(E:VSS_14) U1.N9(E:VSS_15) U1.N11(E:VSS_16) U1.T2(E:VREF-) U1.U1(E:VSS_17) U1.U17(E:VSS) USB_ESD.2(GND) VOLUME_WHEEL.C1(COM)
L_OUT_N: AMPLIFIER_L.10(OUTN) SPEAKER_L.2
L_OUT_P: AMPLIFIER_L.9(OUTP) SPEAKER_L.1
LED-EN: CAMERA_CONNECTOR.12 CAMERA_CONNECTOR.12_1 U1.R1(B:PG3)
LRCLK: AMPLIFIER_L.14(LRCLK) AMPLIFIER_R.14(LRCLK) LRCLK.TP U1.E15(A:PB0)
N$1: C37.2 R18.1
N$5: BATT_CONTROL.5(PROG) R1.2
N$6: BUCK_CONVERTER.9(SS/TR) C34.2
N$7: R28.2
N$8: R29.2
N$9: 25MHZ_CRYSTAL.3(OUT/IN) C27.1 R12.2
N$10: R34.1 U1.A7(B:PH0-OSC_IN)
N$11: 25MHZ_CRYSTAL.1(IN/OUT) C28.2 R34.2
N$12: R36.1 U1.D1(A:PC14-OSC32_IN)
N$13: R35.1 U1.C1(A:PC15-OSC32_OUT)
N$14: 32KHZ_CRYSTAL.2 C29.1 R35.2
N$15: 32KHZ_CRYSTAL.1 C30.2 R36.2
N$22: R12.1 U1.B7(B:PH1-OSC_OUT)
NRST: C31.2 NRST.TP PROGRAMMER.12 R26.1 U1.G3(D:NRST)
OTG1_TXR: R31.2 U1.C6(D:OTG1_TXRTUNE)
OTG2_TXR: R30.2 U1.D6(D:OTG2_TXRTUNE)
PG0: BUCK_CONVERTER.4(PG) PG0.TP R13.1 U1.R13(B:PG0)
POWER-EN: CAMERA_CONNECTOR.11 CAMERA_CONNECTOR.11_1 U1.T11(B:PG2)
PWR_SW: BUCK_CONVERTER.13(EN) POWER_SWITCH.2 R10.2
R_OUT_N: AMPLIFIER_R.10(OUTN) SPEAKER_R.2
R_OUT_P: AMPLIFIER_R.9(OUTP) SPEAKER_R.1
RSVD6: IC1.C2(RSVD6) R7.2
SCL_CAM: CAMERA_CONNECTOR.13 CAMERA_CONNECTOR.13_1 R14.1 SCL_CAM.TP U1.U11(A:PB10)
SCROLL_1: C62.1 U1.E14(A:PD8) VOLUME_WHEEL.1
SCROLL_2: C63.1 U1.A9(A:PC1) VOLUME_WHEEL.2
SCROLL_NO: C64.1 U1.D9(A:PC2) VOLUME_WHEEL.T1(NO)
SD_MODE: AMPLIFIER_L.4(SD_MODE) R32.1 SDMODE.TP U1.R11(A:PB1)
SD_MODE_R: AMPLIFIER_R.4(SD_MODE) R32.2
SDA_CAM: CAMERA_CONNECTOR.14 CAMERA_CONNECTOR.14_1 R15.1 SDA_CAM.TP U1.P10(A:PB11)
SENS: PUSHBUTTON2.1 R19.2
SW_NODE: BUCK_CONVERTER.1(SW) BUCK_CONVERTER.2(SW) BUCK_CONVERTER.3(SW) L2.1
SWCLK: PROGRAMMER.6 SWCLK.TP U1.T6(A:PA14)
SWDIO: PROGRAMMER.4 TP_SWDIO.TP U1.U6(A:PA13)
SWO: PROGRAMMER.8 U1.U12(A:PB5)
TOF-LPN: IC1.A5(LPN) R27.2 U1.A14(A:PD1)
TOF_I2C_RST: IC1.A1(I2C_RST_1) IC1.A8(I2C_RST_2) R2.2 U1.F17(B:PE1)
TOF_INT: IC1.A3(INT) R6.1 U1.F16(B:PE0)
TOF_SCL: BREAKOUT_TOF_1.3 BREAKOUT_TOF_2.3 BREAKOUT_TOF_3.3 IC1.C4(SCL) R21.2 TOF_SCL.TP U1.D16(A:PB8)
TOF_SDA: BREAKOUT_TOF_1.2 BREAKOUT_TOF_2.2 BREAKOUT_TOF_3.2 IC1.C3(SDA) R22.2 TOF_SDA.TP U1.D15(A:PB9)
TONE: PUSHBUTTON1.1 R20.2
USB_CON_N: R29.1 USB_ESD.4(I/O2_OUT)
USB_CON_P: R28.1 USB_ESD.6(I/O1_OUT)
USB_HSD_N: MICROUSB_HEADER.2 USB_ESD.3(I/O2_IN)
USB_HSD_P: MICROUSB_HEADER.3 USB_ESD.1(I/O1_IN)
USB_POWER: FUSE.2 MICROUSB_HEADER.1
V08CAP: C26.2 U1.F1(E:V08CAP)
VBAT: BATT_CONTROL.3(VBAT) BUCK_CONVERTER.10(AVIN) BUCK_CONVERTER.11(PVIN) BUCK_CONVERTER.12(PVIN) C32.2 C61.2 C74.2 POWER_SWITCH.3 Q1.3(D) VBAT.TP
VCP_RX: PROGRAMMER.13 RX.TP U1.P9(A:PA1)
VCP_TX: PROGRAMMER.14 TX.TP U1.U10(A:PA0)
VDD_CORE: C35.2 C36.2 C44.1 C45.1 C46.1 C47.1 C48.1 C49.1 C50.1 C51.1 C52.1 C57.2 C58.2 C73.1 L1.1 U1.G2(E:VFBSMPS) U1.L6(E:VDDCORE_2) U1.L12(E:VDDCORE_3) U1.M7(E:VDDCORE_4) U1.M9(E:VDDCORE_5) U1.M11(E:VDDCORE_6) U1.N8(E:VDDCORE_7) U1.N10(E:VDDCORE_8) U1.N12(E:VDDCORE_9) U1.P11(E:VDDCORE) U1.R4(E:VDDCSI) VDD_CORE.TP
VLXSMPS: L1.2 R18.2 U1.J1(E:VLXSMPS_2) U1.J2(E:VLXSMPS_3) U1.J3(E:VLXSMPS_4) U1.J4(E:VLXSMPS_5) U1.J5(E:VLXSMPS_6) U1.J6(E:VLXSMPS)
Unconnected: 3.3V_TO_1.8V.4(N/C) BATT_CONTROL.1(STAT) IC1.C5(RSVD5) MICROUSB_HEADER.4 MICROUSB_HEADER.MH1 PROGRAMMER.1 PROGRAMMER.2 PROGRAMMER.9 PROGRAMMER.10 PUSHBUTTON1.2 PUSHBUTTON1.4 PUSHBUTTON2.2 PUSHBUTTON2.4 U1.A2(C:PQ6) U1.A3(D:OTG2_HSDM) U1.A5(D:OTG1_HSDM) U1.A6(D:UCPD1_CC1) U1.A11(B:PE13) U1.A12(B:PE15) U1.A13(A:PD10) U1.B1(B:PH3) U1.B2(B:PH6) U1.B3(D:OTG2_HSDP) U1.B4(D:OTG1_VBUS) U1.B5(D:OTG1_HSDP) U1.B6(D:UCPD1_CC2) U1.B10(A:PC5) U1.B11(B:PE14) U1.B12(B:PE12) U1.B13(B:PE7) U1.B14(A:PD15) U1.B15(A:PD4) U1.B16(B:PE10) U1.B17(A:PB14) U1.C2(B:PH8) U1.C3(D:OTG1_ID) U1.C4(D:OTG2_VBUS) U1.C9(A:PC7) U1.C10(A:PC0) U1.C11(B:PE5) U1.C12(A:PD2) U1.C13(A:PD12) U1.C14(A:PD14) U1.C15(A:PB13) U1.D2(B:PH7) U1.D3(C:PQ3) U1.D4(C:PQ4) U1.D5(C:PQ5) U1.D8(B:PH9) U1.D10(B:PE4) U1.D12(A:PD6) U1.D13(A:PD0) U1.D14(A:PD5) U1.D17(A:PB15) U1.E2(D:PWR_ON) U1.E3(C:PQ2) U1.E4(C:PQ1) U1.E5(C:PQ0) U1.E6(D:OTG2_ID) U1.E10(A:PC3) U1.E11(B:PE11) U1.E16(A:PB7) U1.F3(A:PC13) U1.F4(B:PH4) U1.F5(B:PH5) U1.F13(A:PB3) U1.F14(B:PE3) U1.F15(B:PE2) U1.G5(C:PQ7) U1.G14(A:PD11) U1.G15(C:PP7) U1.G16(C:PP6) U1.G17(C:PP0) U1.H14(A:PD9) U1.H15(C:PP4) U1.H16(C:PP1) U1.H17(C:PP15) U1.J14(C:PP5) U1.J15(C:PP12) U1.J16(C:PP3) U1.J17(C:PP2) U1.K14(C:PP13) U1.K15(C:PO5) U1.K16(C:PO1) U1.K17(C:PO2) U1.L1(B:PG7) U1.L2(B:PF4) U1.L3(B:PG6) U1.L4(B:PF10) U1.L5(B:PF6) U1.L15(C:PP11) U1.L16(C:PP8) U1.L17(C:PP14) U1.M1(B:PF7) U1.M2(B:PF3) U1.M3(B:PF5) U1.M4(B:PG5) U1.M16(C:PO3) U1.M17(C:PO0) U1.N1(B:PF15) U1.N2(B:PF14) U1.N3(B:PF8) U1.N14(C:PP9) U1.N15(C:PP10) U1.N16(C:PO4) U1.N17(C:PN4) U1.P2(B:PG4) U1.P3(B:PF11) U1.P6(B:PG14) U1.P7(A:PA9) U1.P12(A:PA15) U1.P14(C:PN12) U1.P15(C:PN6) U1.P16(C:PN8) U1.P17(C:PN0) U1.R2(B:PF13) U1.R3(B:PF0) U1.R6(B:PG15) U1.R7(A:PA10) U1.R8(A:PA5) U1.R9(B:PG1) U1.R10(A:PB12) U1.R12(A:PA7) U1.R14(A:PA3) U1.R15(C:PN3) U1.R16(C:PN5) U1.R17(C:PN1) U1.T7(A:PA11) U1.T8(A:PA2) U1.T9(B:PG12) U1.T10(B:PG10) U1.T12(A:PB4) U1.T13(B:PG9) U1.T14(B:PG8) U1.T15(C:PN9) U1.T16(C:PN7) U1.T17(C:PN2) U1.U8(A:PA8) U1.U9(B:PG13) U1.U13(B:PG11) U1.U14(A:PA4) U1.U15(C:PN10) U1.U16(C:PN11)

## Notes on the sheet
- MicroUSB + LiPo
  Battery Power Input
  System
- Mounting Holes
- MicroUSB data lines
- MicroUSB ESD
  Protection
- need to enable 
  internal pull-ups
  for these signals!!
- ST
- <--- 
       |
       |
- ferrite bead for cleaner 1.8V out
- REFER TO "Getting started" DATASHEET FOR U1E CONNECTIONS + CAPS
- diode for MicroUSB
  overvoltage protection
- technically a
  "thumbwheel"
  <----
- Data lines 
  no connect -
  - power only
- VDDA18 need
  stable +1.8V
- |
       |
  <---
- TPS7 (linear regulator)
  only used for our
  STM32 power systems
- C38-C43
  all 0.1uF
- fuse for MicroUSB
  overcurrent protection
- pushbutton for
  changing the tone
  of the audio output
- device powered
  via MicroUSB
- cleaner
  3.3V
- Scroll
  Volume
  Wheel
- replacing STAT
  with BAT_SENSE
- Pierce oscillator equation to find cap values
- protect reverse
  voltage
- charge at 500 mA
- VSS pins all GND
- C2 C3 10uF
  C23 C4 1uF
  C22 C5 0.1uF
- two LiPo batteries charged via MicroUSB
- Pushbuttons for
  adjusting feedback
  tone and sensor
  sensitivity
- STM32N657X0H3Q
  POWER PIN
  CONNECTIONS
- ToF
- C44-C52 all 1uF
- 32kHz 
  Oscillator
- Camera
- SWD 
  connection
- may or may not need R35, R36
  (just in case)
- VBAT 3.3V typical | up to 4.7V in
- buck converter for
  MCU+parts
- ADC reference voltage = VDD18ADC
- pushbutton for
  changing the
  sensitivity of
  our sensors
- backup output
- STDC14 connector | store testing data
- 3.3V out ------->
- need pull ups to 
  prevent floating on
  data/cmd pins
- battery percentage reader circuit
- to
  PA12
- SMPS
  ENABLED!
  ---->
- SDCard current
  requires capacitor
- output cap
- C6-C18,
  C20,C21 
  all 0.1uF
- MicroSD
  Card
  Module
- power switch uses
  buck converter to
   disable all components
- Left Speaker+Amp
- IOVDD decouple
- interface reset
- PB8
  +
  PB9
- ToF
  I2C
  -->
- bit clock out
- Front-facing
  ToF
- don't need 
  OTG for 
  our USB
- data input | AVDD decouple
- Power
  Switch
- 1% resistor
- for USBC
- frame clock | <- output pin
- headers, speakers will
  extend close to ear on headset
- PDR_ON 
  needs 1.8V
- left or right audio 
  depending on obstacle
- SD_MODE
  determines
  which is
  left and right
- I2S bus
  PB0
  PB2
  PB6
- Stereo PCM Operation Using Two ICs
- 25MHz Oscillator
- INT
  LPN
  RST
  pull up/pull downs
- Speaker 
  + Amplifer
  Stereo 
  Configuration
- may or may not need R12, R34
  (just in case)
- Comms enable | IOVDD decouple
- Camera Header
  for front-facing
  module
- AVDD decouple
- Breakout
  SATEL
  ToF
  Sensors
- pinouts from
  standard raspberry
   pi camera pinout
- Right Speaker+Amp
- Pierce oscillator
  equation to find 
  cap values
- On-Board
  ToF Sensor
  Connections
- INT
  LPN
  RST
  pull up/pull downs
- ---------->
  Camera I2C
- PB10 + PB11
- IOVDD decouple
- Can be connected to
  break-off side or
  SATEL on-board
  regulator
- AVDD decouple
- No connections to this one
- Unused
- INT
  LPN
  RST
  pull up/pull downs

## Library data of the parts
3.3V_TO_1.8V = Claritone_Lib:TPS7A2018PDBVR; CHECK_PRICES: https://www.snapeda.com/parts/TPS7A2018PDBVR/Texas+Instruments/view-part/?ref=eda; DESCRIPTION: 300mA ultra-low-noise low-IQ low-dropout (LDO) linear regulator with high PSRR; DIGIKEY_PART_NUMBER: 296-TPS7A2018PDBVRCT-ND; MF: Texas Instruments; MP: TPS7A2018PDBVR; PACKAGE: SOT-23-5 Texas Instruments; SNAPEDA_LINK: https://www.snapeda.com/parts/TPS7A2018PDBVR/Texas+Instruments/view-part/?ref=snap
3V3 BCLK GND GND1 GND2 LRCLK NRST PG0 PVDD PVDD1 RX SCL_CAM SDA_CAM SDMODE SWCLK TOF_SCL TOF_SDA TP3V3_ANA TP_1V8 TP_1V8_ANA TP_3V3 TP_3V31 TP_5V_USB TP_SWDIO TX VBAT VDD_CORE = testpad:TP: Test pad
25MHZ_CRYSTAL = Claritone_Lib:ECS-250-10-33B-CWN-TR; CHECK_PRICES: https://www.snapeda.com/parts/ECS-250-10-33B-CWN-TR/ECS/view-part/?ref=eda; DESCRIPTION: 25 MHz ±10ppm Crystal 10pF 40 Ohms 4-SMD, No Lead; DIGIKEY_PART_NUMBER: XC2480CT-ND; MF: ECS Inc.; MP: ECS-250-10-33B-CWN-TR; PACKAGE: ECS-33B ECS Inc.; SNAPEDA_LINK: https://www.snapeda.com/parts/ECS-250-10-33B-CWN-TR/ECS/view-part/?ref=snap
32KHZ_CRYSTAL = Claritone_Lib:ABS07-32.768KHZ-T; CHECK_PRICES: https://www.snapeda.com/parts/ABS07-32.768KHZ-T/Abracon/view-part/?ref=eda; DESCRIPTION: 32.768 kHz ±20ppm Crystal 12.5pF 70 kOhms 2-SMD, No Lead; DIGIKEY_PART_NUMBER: 535-9542-1-ND; MF: Abracon; MP: ABS07-32.768KHZ-T; PACKAGE: SMD-2 Abracon LLC; SNAPEDA_LINK: https://www.snapeda.com/parts/ABS07-32.768KHZ-T/Abracon/view-part/?ref=snap
AMPLIFIER_L AMPLIFIER_R = Claritone_Lib:MAX98357AETE+T; CHECK_PRICES: https://www.snapeda.com/parts/MAX98357AETE+T/Analog+Devices/view-part/?ref=eda; DESCRIPTION: Tiny, Low-Cost, PCM Class D Amplifier with Class AB Performance; DIGIKEY_PART_NUMBER: MAX98357AETE+TCT-ND; MF: Analog Devices; MP: MAX98357AETE+T; PACKAGE: TQFN-16 Maxim; SNAPEDA_LINK: https://www.snapeda.com/parts/MAX98357AETE+T/Analog+Devices/view-part/?ref=snap
BATT1 BATT2 = Claritone_Lib:B2B-PH-K-S; CHECK_PRICES: https://www.snapeda.com/parts/B2B-PH-K-S/JST/view-part/?ref=eda; DESCRIPTION: Connector Header Through Hole 2 position 0.079 (2.00mm); DIGIKEY_PART_NUMBER: 455-1704-ND; MF: JST Sales; MP: B2B-PH-K-S; PACKAGE: None; SNAPEDA_LINK: https://www.snapeda.com/parts/B2B-PH-K-S/JST/view-part/?ref=snap
BATT_CONTROL = Claritone_Lib:MCP73831T-2ACI/OT; CHECK_PRICES: https://www.snapeda.com/parts/MCP73831T-2ACI/OT/Microchip+Technology/view-part/?ref=eda; DESCRIPTION: TINY INTEGRATED LI-ION/LI-POLY CHARGE MGNT CONTROLLER, 4.2V VREG | Microchip Technology Inc. MCP73831T-2ACI/OT; DIGIKEY_PART_NUMBER: MCP73831T-2ACI/OTCT-ND; MF: Microchip; MP: MCP73831T-2ACI/OT; PACKAGE: SOT-23 Microchip; SNAPEDA_LINK: https://www.snapeda.com/parts/MCP73831T-2ACI/OT/Microchip+Technology/view-part/?ref=snap
BREAKOUT_TOF_1-BREAKOUT_TOF_3 = Claritone_Lib:JST_GH_1X09_BM09B-GHS-TBT
BUCK_CONVERTER = Claritone_Lib:TPS62132RGTR; CHECK_PRICES: https://www.snapeda.com/parts/TPS62132RGTR/Texas+Instruments/view-part/?ref=eda; DESCRIPTION: 3-17V 3A Step-Down Converter in 3x3 QFN Package; DIGIKEY_PART_NUMBER: 296-29936-1-ND; MF: Texas Instruments; MP: TPS62132RGTR; PACKAGE: VQFN-16 Texas Instruments; SNAPEDA_LINK: https://www.snapeda.com/parts/TPS62132RGTR/Texas+Instruments/view-part/?ref=snap
C1 C4-C31 C34 C37-C53 C55 C56 C60-C66 C68 C70-C73 C75 C77 C80 = Capacitor:C: Capacitor - Generic; CATEGORY: Capacitor; PACKAGE_SIZE: 0402; PACKAGE_TYPE: Surface Mount; SUBCATEGORY: Ceramic Capacitors; TYPE: MLCC
C2 C3 C32 C33 C35 C36 C54 C57-C59 C67 C69 C74 C76 C78 C79 = Capacitor:C: Capacitor - Generic; CATEGORY: Capacitor; PACKAGE_SIZE: 0603; PACKAGE_TYPE: Surface Mount; SUBCATEGORY: Ceramic Capacitors; TYPE: MLCC
CAMERA_CONNECTOR = Claritone_Lib:1-1734248-5; CHECK_PRICES: https://www.snapeda.com/parts/1-1734248-5/TE+Connectivity+AMP+Connectors/view-part/?ref=eda; COMMENT: 1-1734248-5; DESCRIPTION: 15 Position FPC Connector Contacts, Vertical - 1 Sided 0.039 (1.00mm) Surface Mount; DIGIKEY_PART_NUMBER: A101418CT-ND; MF: TE Connectivity; MP: 1-1734248-5; PACKAGE: None; SNAPEDA_LINK: https://www.snapeda.com/parts/1-1734248-5/TE+Connectivity+AMP+Connectors/view-part/?ref=snap
FL1 FL2 = Claritone_Lib:BLM18AG121SN1D; CHECK_PRICES: https://www.snapeda.com/parts/BLM18AG121SN1D/Murata/view-part/?ref=eda; DESCRIPTION: 120 Ohms @ 100 MHz 1 - Ferrite Bead 0603 (1608 Metric) 800mA 180mOhm; DIGIKEY_PART_NUMBER: 490-1011-1-ND; MF: Murata; MP: BLM18AG121SN1D; PACKAGE: 1608 Murata; SNAPEDA_LINK: https://www.snapeda.com/parts/BLM18AG121SN1D/Murata/view-part/?ref=snap
FUSE = Claritone_Lib:MF-PSMF075X-2: Bourns 0.75A Surface Mount Resettable Fuse, 6V Source: Datasheet <https://www.bourns.com/docs/Product-Datasheets/mfpsmf.pdf>; DESCRIPTION: Bourns 0.75A Surface Mount Resettable Fuse, 6V; HEIGHT: 1mm; MANUFACTURER_NAME: Bourns; MANUFACTURER_PART_NUMBER: MF-PSMF075X-2; MOUSER_PART_NUMBER: 652-MF-PSMF075X-2; MOUSER_PRICE-STOCK: https://www.mouser.co.uk/ProductDetail/Bourns/MF-PSMF075X-2?qs=89sKJMJLNwwVlFH0F%2F6dtA%3D%3D
H5-H8 = holes:MOUNT-PAD-ROUND: MOUNTING PAD, round
IC1 = VL53:VL53L7CXV0GC_1: Time-of-Flight 8x8 multizone ranging sensor with 90 degrees FoV Source: Datasheet <https://www.st.com/resource/en/datasheet/vl53l7cx.pdf>; ARROW_PART_NUMBER: VL53L7CXV0GC/1; ARROW_PRICE-STOCK: https://www.arrow.com/en/products/vl53l7cxv0gc1/stmicroelectronics?utm_currency=USD&region=nac; DESCRIPTION: Time-of-Flight 8x8 multizone ranging sensor with 90 degrees FoV; HEIGHT: mm; MANUFACTURER_NAME: STMicroelectronics; MANUFACTURER_PART_NUMBER: VL53L7CXV0GC/1; MOUSER_PART_NUMBER: 511-VL53L7CXV0GC/1; MOUSER_PRICE-STOCK: https://www.mouser.co.uk/ProductDetail/STMicroelectronics/VL53L7CXV0GC-1?qs=Znm5pLBrcAJT31SCy%252Bo4iQ%3D%3D
L1 = Claritone_Lib:DFE201612E-1R0M=P2; CHECK_PRICES: https://www.snapeda.com/parts/DFE201612E-1R0M=P2/Murata+Electronics+North+America/view-part/?ref=eda; DESCRIPTION: Inductor with Inductance: 1uH Tol. +/-20%, Package: 0806 (2016); DIGIKEY_PART_NUMBER: 490-16593-1-ND; MF: Murata Electronics; MP: DFE201612E-1R0M=P2; PACKAGE: 2016 Murata; SNAPEDA_LINK: https://www.snapeda.com/parts/DFE201612E-1R0M=P2/Murata+Electronics+North+America/view-part/?ref=snap
L2 = Claritone_Lib:XFL4020-222MEC: Check availability <https://pricing.snapeda.com/parts/XFL4020-222MEC/Coilcraft/view-part?ref=eda>; AVAILABILITY: In Stock; CHECK_PRICES: https://www.snapeda.com/parts/XFL4020-222MEC/Coilcraft/view-part/?ref=eda; DESCRIPTION: 2.2 µH Shielded Molded Inductor 8 A 23.5mOhm Max 1616 (4040 Metric); MF: Coilcraft; MP: XFL4020-222MEC; PACKAGE: None; PRICE: None; SNAPEDA_LINK: https://www.snapeda.com/parts/XFL4020-222MEC/Coilcraft/view-part/?ref=snap
MICROSD_CARD = Claritone_Lib:DM3AT-SF-PEJM5; CHECK_PRICES: https://www.snapeda.com/parts/DM3AT-SF-PEJM5/Hirose+Electric+Co+Ltd/view-part/?ref=eda; DESCRIPTION: 10 (8 + 2) Position Card Connector Secure Digital - microSD™ Surface Mount, Right Angle Gold; DIGIKEY_PART_NUMBER: HR1964CT-ND; MF: Hirose Electric Co Ltd; MP: DM3AT-SF-PEJM5; PACKAGE: None; SNAPEDA_LINK: https://www.snapeda.com/parts/DM3AT-SF-PEJM5/Hirose+Electric+Co+Ltd/view-part/?ref=snap
MICROUSB_HEADER = Claritone_Lib:10118194-0001LF: Micro USB, Input Output Connectors, B TYPE RECEPTACLE with flange Source: Datasheet <https://www.amphenol-cs.com/micro-usb-101181940001lf.html>; DESCRIPTION: Micro USB, Input Output Connectors, B TYPE RECEPTACLE with flange; HEIGHT: 3.25mm; MANUFACTURER_NAME: Amphenol Communications Solutions; MANUFACTURER_PART_NUMBER: 10118194-0001LF
POWER_SWITCH = Claritone_Lib:OS102011MA1QN1; CHECK_PRICES: https://www.snapeda.com/parts/OS102011MA1QN1/Littelfuse/view-part/?ref=eda; DESCRIPTION: Switch Slide ON ON SPDT Side Slide 0.1A 12VDC 10000Cycles PC Pins Bracket Mount/Through Hole Bulk; DIGIKEY_PART_NUMBER: CKN9559-ND; MF: Littelfuse/C&K; MP: OS102011MA1QN1; PACKAGE: None; SNAPEDA_LINK: https://www.snapeda.com/parts/OS102011MA1QN1/Littelfuse/view-part/?ref=snap
PROGRAMMER = Claritone_Lib:FTSH-107-01-L-DV-K-A: 14 position, High Reliability Header Strips, 0.050" pitch, Dual-Row Vertical Source: Datasheet <http://suddendocs.samtec.com/prints/ftsh-1xx-xx-xxx-dv-xxx-xxx-mkt.pdf>; DESCRIPTION: 14 position, High Reliability Header Strips, 0.050&quot; pitch, Dual-Row Vertical; HEIGHT: mm; MANUFACTURER_NAME: SAMTEC; MANUFACTURER_PART_NUMBER: FTSH-107-01-L-DV-K-A; MOUSER_PART_NUMBER: 200-FTSH10701LDVKA; MOUSER_PRICE-STOCK: https://www.mouser.co.uk/ProductDetail/Samtec/FTSH-107-01-L-DV-K-A?qs=PB6%2FjmICvI3xEHFou4PhNg%3D%3D
PUSHBUTTON1 PUSHBUTTON2 = Claritone_Lib:B3F-3120; COPYRIGHT: Copyright (C) 2026 Ultra Librarian. All rights reserved.; DIGIKEY_PART_NUMBER_1: SW407-ND; DIGIKEY_PART_NUMBER_2: SW407-NDL; MANUFACTURER_NAME: Omron; MANUFACTURER_PART_NUMBER: B3F-3120
Q1 = Claritone_Lib:DMG2301L-7: P-Channel 20 V 3A (Ta) 1.5W (Ta) Surface Mount SOT-23-3 Source: Datasheet <https://www.diodes.com//assets/Datasheets/DMG2301L.pdf>; DESCRIPTION: P-Channel 20 V 3A (Ta) 1.5W (Ta) Surface Mount SOT-23-3; HEIGHT: 1.15mm; MANUFACTURER_NAME: Diodes Incorporated; MANUFACTURER_PART_NUMBER: DMG2301L-7; MOUSER_PART_NUMBER: 621-DMG2301L-7; MOUSER_PRICE-STOCK: https://www.mouser.co.uk/ProductDetail/Diodes-Incorporated/DMG2301L-7?qs=60RJRzIpcl8mqpUzCaZuxQ%3D%3D
R1-R46 = Tinkercad:RESISTOR: Resistor Fixed - Generic; CATEGORY: Resistor; SUB-CATEGORY: Fixed
SPEAKER_L SPEAKER_R = Claritone_Lib:BM02B-SRSS-TB_(LF)(SN); COPYRIGHT: Copyright (C) 2026 Ultra Librarian. All rights reserved.; DIGIKEY_PART_NUMBER_1: 455-1788-2-ND; DIGIKEY_PART_NUMBER_2: 455-1788-1-ND; DIGIKEY_PART_NUMBER_3: 455-1788-6-ND; MANUFACTURER_NAME: JST; MANUFACTURER_PART_NUMBER: BM02B-SRSS-TB (LF)(SN)
SW1 = Claritone_Lib:A6S-2102-H; COPYRIGHT: Copyright (C) 2026 Ultra Librarian. All rights reserved.; DIGIKEY_PART_NUMBER_1: SW1008-ND; MANUFACTURER_NAME: Omron; MANUFACTURER_PART_NUMBER: A6S-2102-H
TVS = Claritone_Lib:SD05.TCT: Single Line TVS Diode for ESD Protection Source: Datasheet <https://datasheet.datasheetarchive.com/originals/distributors/Datasheets-DGA26/1841681.pdf>; DESCRIPTION: Single Line TVS Diode for ESD Protection; HEIGHT: 1.1mm; MANUFACTURER_NAME: SEMTECH; MANUFACTURER_PART_NUMBER: SD05.TCT; MOUSER_PART_NUMBER: 947-SD05.TCT; MOUSER_PRICE-STOCK: https://www.mouser.co.uk/ProductDetail/Semtech/SD05.TCT?qs=rBWM4%252BvDhIed78qt1y4o0Q%3D%3D
U1 = Claritone_Lib:STM32N657X0H3Q; COPYRIGHT: Copyright (C) 2026 Ultra Librarian. All rights reserved.; DATASHEET: https://www.st.com/resource/en/datasheet/stm32n657a0.pdf; DESCRIPTION: High performance Arm Cortex-M55 MCU, 800MHz, 4.2MB SRAM, Neural-ART accelerator 600 GOPS, NeoChrom GPU, JPEG Codec, H-264 enc, HW crypto; MANUFACTURER_NAME: STMicroelectronics; MANUFACTURER_PART_NUMBER: STM32N657X0H3Q
USB_ESD = Claritone_Lib:USBLC6-2SC6; CHECK_PRICES: https://www.snapeda.com/parts/USBLC6-2SC6/STMicroelectronics/view-part/?ref=eda; DESCRIPTION: 17V Clamp 5A (8/20µs) Ipp Tvs Diode Surface Mount SOT-23-6; DIGIKEY_PART_NUMBER: 497-5235-1-ND; MF: STMicroelectronics; MP: USBLC6-2SC6; PACKAGE: SOT-23-6 STMicroelectronics; SNAPEDA_LINK: https://www.snapeda.com/parts/USBLC6-2SC6/STMicroelectronics/view-part/?ref=snap
VOLUME_WHEEL = Claritone_Lib:SLLB510100: Multi-Directional Switches Lever push w/ lug 9.5x8.8x2.2mm Source: Datasheet; DESCRIPTION: Multi-Directional Switches Lever push w/ lug 9.5x8.8x2.2mm; HEIGHT: mm; MANUFACTURER_NAME: ALPS Electric; MANUFACTURER_PART_NUMBER: SLLB510100